# Altium schematic sheet Control-Sheet.SchDoc (part 2 of 3)
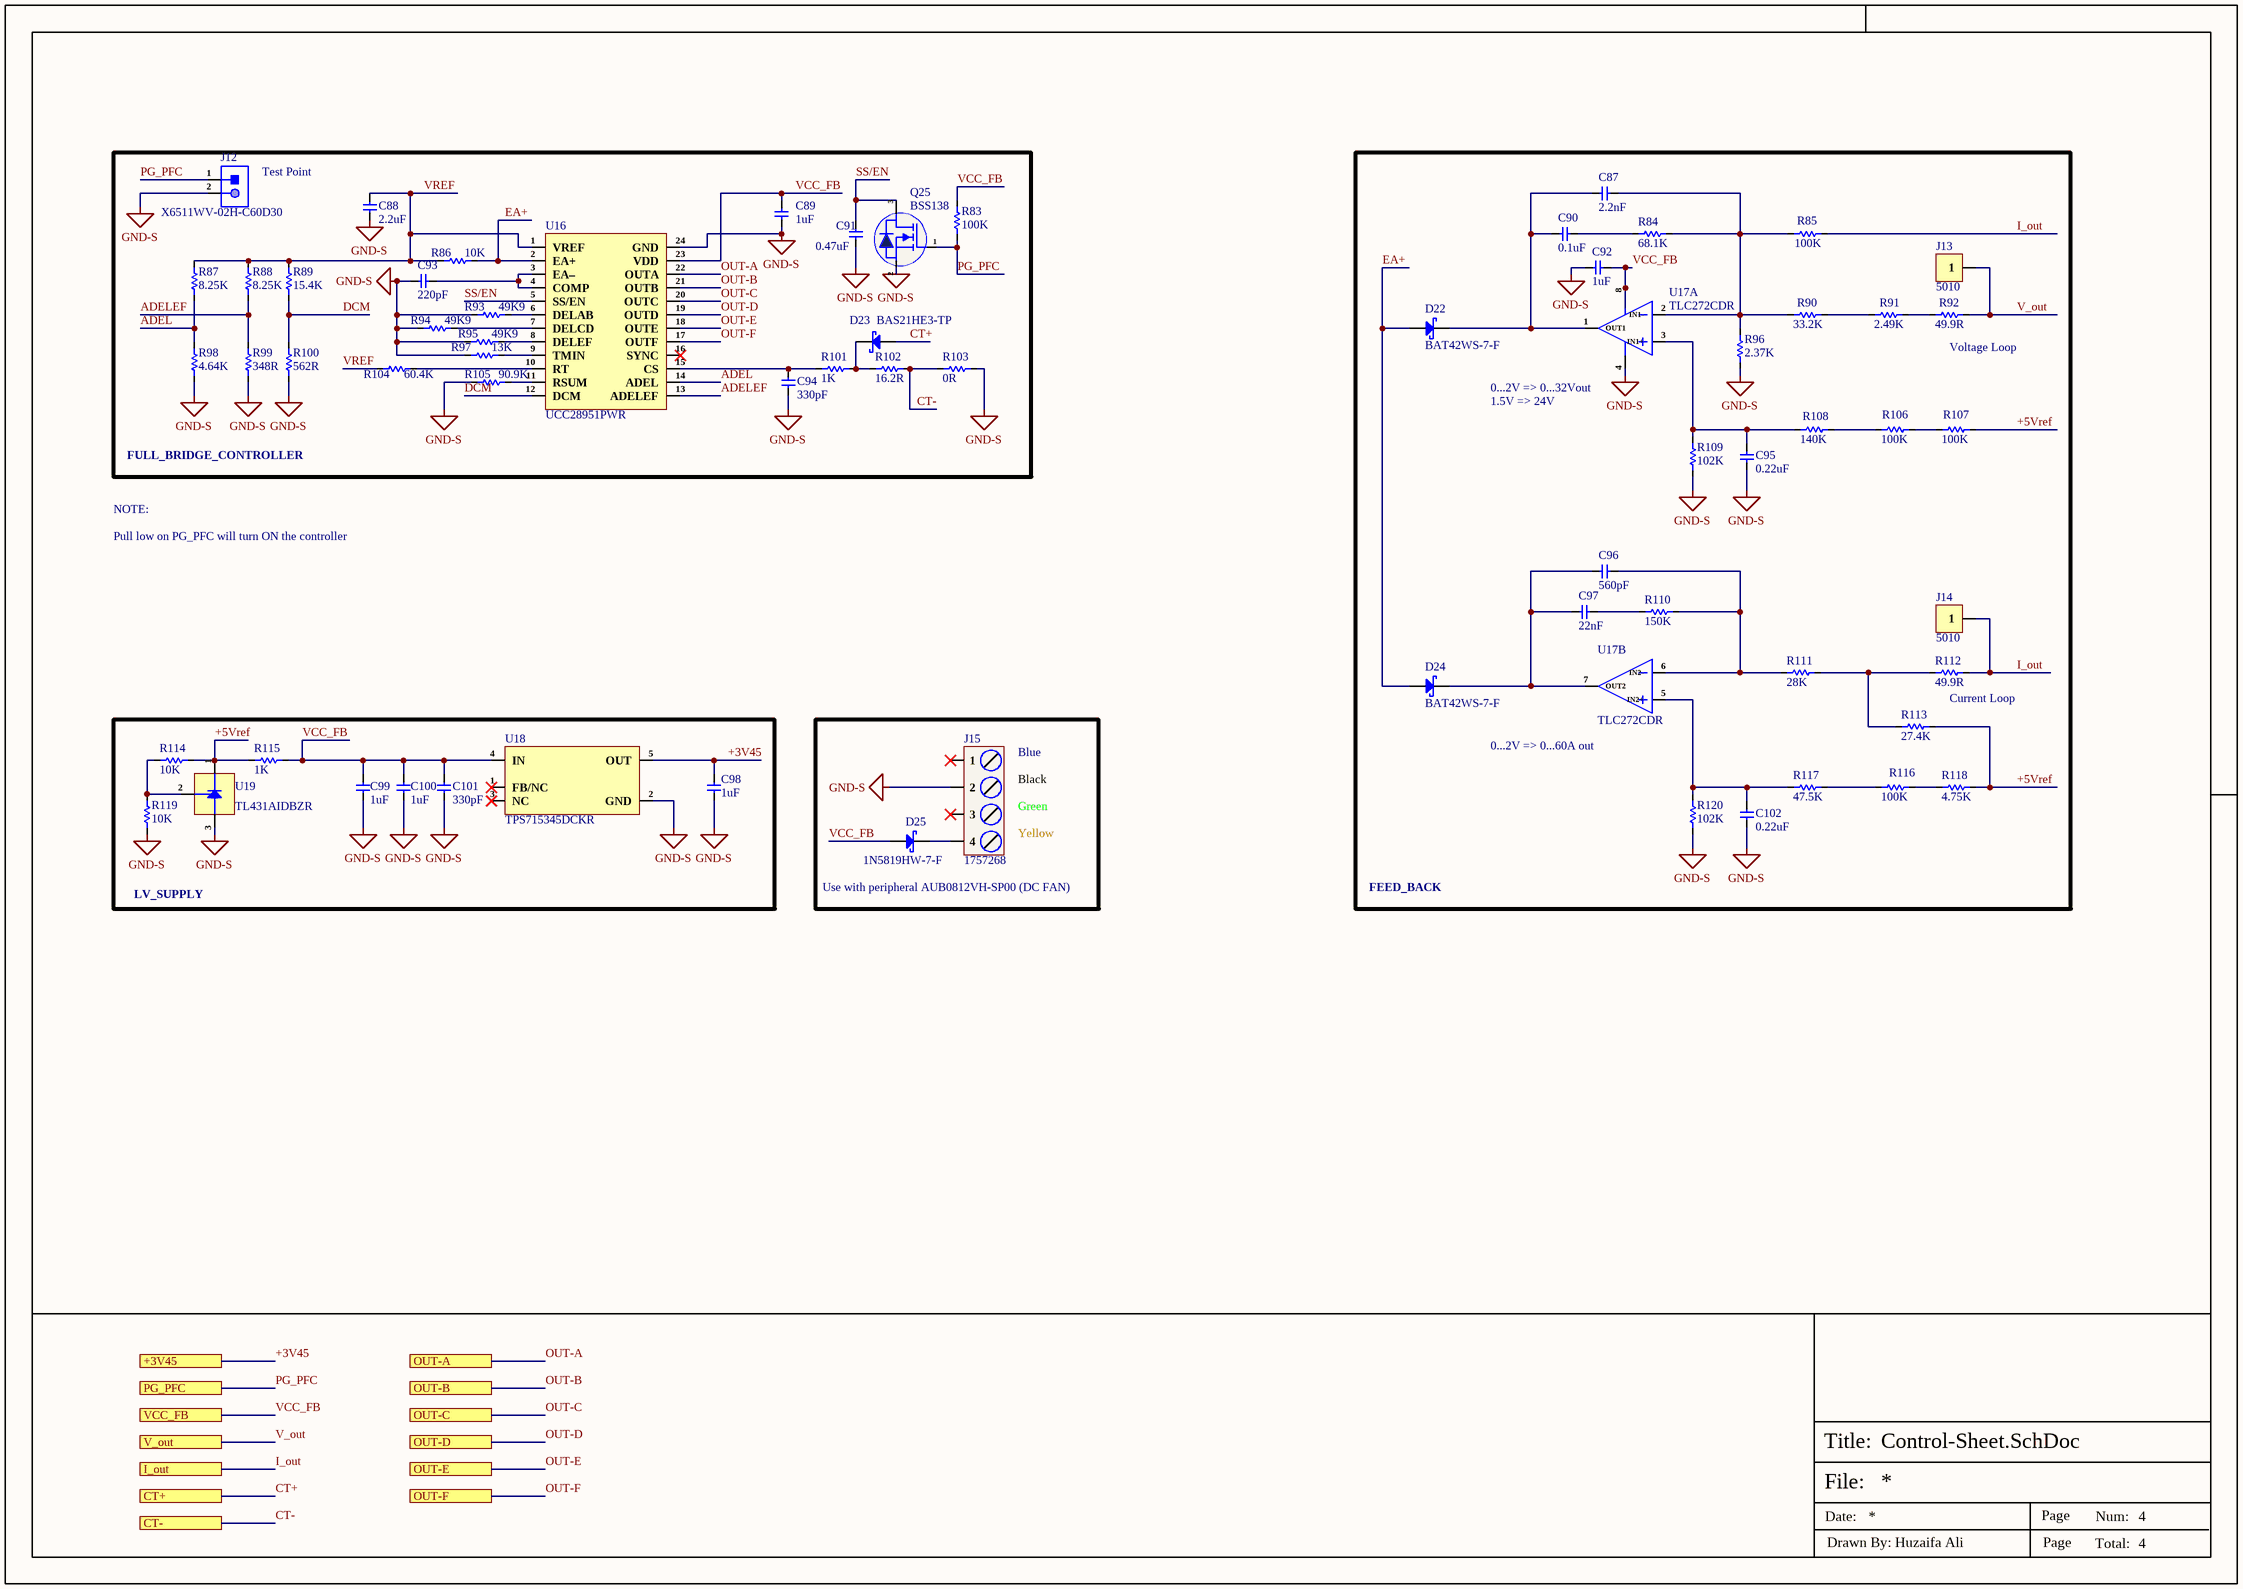
[diagram p1: Control-Sheet.SchDoc]
## Library data of the parts
C87 = C1608C0G1H222JT000N: CAP CER 2200PF 50V C0G 0603; Manufacturer: TDK Corporation; Manufacturer Part Number: C1608C0G1H222J080AA; Item Type: Capacitor; Package: 0603; LCSC Part Number: C76601; ComponentLink1Description: LCSC; ComponentLink1URL: https://www.lcsc.com/product-detail/Multilayer-Ceramic-Capacitors-MLCC-SMD-SMT_TDK-C1608C0G1H222JT000N_C76601.html
C88 = EMK212B7225KGHT: CAP CER 2.2UF 16V X7R 0805; Manufacturer: Taiyo Yuden; Item Type: Capacitors; Material: 4241ConductorMaterial; Supplier: Digikey; LCSC Part Number: C385899; Manufacturer Part Number: EMK212B7225KGHT; RoHS: Yes; Stock: 8236; Pricing: 1=0.24, 10=0.137, 50=0.097, 100=0.0847, 500=0.06374, 1000=0.05721 (USD); Lead Free: 5697LeadFree; Halogen Free: 5694HalogenFree; ComponentLink1URL: http://www.mouser.com/ds/2/396/mlcc11_hq_e-541564.pdf?src-supplier=Mouser; ComponentLink1Description: http://www.mouser.com/ds/2/396/mlcc11_hq_e-541564.pdf?src-supplier=Mouser; ComponentLink2URL: https://datasheet.octopart.com/EMK212B7225KGHT-Taiyo-Yuden-datasheet-152732874.pdf?src-supplier=Newark; ComponentLink2Description: https://datasheet.octopart.com/EMK212B7225KGHT-Taiyo-Yuden-datasheet-152732874.pdf?src-supplier=Newark; ComponentLink3URL: https://datasheet.octopart.com/EMK212B7225KGHT-Taiyo-Yuden-datasheet-97186030.pdf?src-supplier=Future+Electronics; ComponentLink3Description: https://datasheet.octopart.com/EMK212B7225KGHT-Taiyo-Yuden-datasheet-97186030.pdf?src-supplier=Future+Electronics; ComponentLink4URL: https://ds.yuden.co.jp/TYCOMPAS/ut/detail?pn=EMK212B7225KGHT  &amp;u=M&src-supplier=Digikey; ComponentLink4Description: https://ds.yuden.co.jp/TYCOMPAS/ut/detail?pn=EMK212B7225KGHT  &amp;u=M&src-supplier=Digikey; ComponentLink5URL: http://www.yuden.co.jp/productdata/catalog/en/mlcc01_hq_e.pdf?src-supplier=Digikey; ComponentLink5Description: http://www.yuden.co.jp/productdata/catalog/en/mlcc01_hq_e.pdf?src-supplier=Digikey; ComponentLink6URL: http://www.yuden.co.jp/ut/product/category/capacitor/putpdf/EMK212B7225KGHT.pdf?src-supplier=Avnet; ComponentLink6Description: http://www.yuden.co.jp/ut/product/category/capacitor/putpdf/EMK212B7225KGHT.pdf?src-supplier=Avnet; ComponentLink7URL: https://datasheet.octopart.com/EMK212B7225KGHT-Taiyo-Yuden-datasheet-154808297.pdf?src-supplier=Master+Electronics; ComponentLink7Description: https://datasheet.octopart.com/EMK212B7225KGHT-Taiyo-Yuden-datasheet-154808297.pdf?src-supplier=Master+Electronics
C89 C92 C98-C100 = C1608X7R1E105K080AB: CAP CER 1UF 25V X7R 0603; Manufacturer: TDK; Item Type: Capacitors; Material: 4241ConductorMaterial; Tolerance: 10%; Supplier: Digikey; Manufacturer Part Number: C1608X7R1E105K080AB; RoHS: Yes; Stock: 239206; Pricing: 1=0.18, 10=0.103, 50=0.0722, 100=0.0627, 500=0.04664, 1000=0.04163 (USD); Mounting Technology: Surface Mount; Case/Package: 0603; Case Code (Metric): 1608; Case Code (Imperial): 0603; Dielectric Material: 4241ConductorMaterial; Min Operating Temperature: -55°C; Max Operating Temperature: 125°C; Value: 1uF; Package Quantity: 1; Voltage Rating: 25V; Packaging: Tape and Reel; Dielectric: X7R; Voltage: 25V; Series: C; Construction: Flat; Length: 1.6mm; Width: 0.031inch; Height: 0.8mm; Thickness: 0.037inch; Depth: 0.8mm; Radiation Hardening: No; Reach SVHC Compliant: No; Lead Free: Lead Free; RoHS Compliant: Yes; ComponentLink1URL: https://datasheet.ciiva.com/23802/1796654-23802776.pdf?src-supplier=Newark; ComponentLink1Description: https://datasheet.ciiva.com/23802/1796654-23802776.pdf?src-supplier=Newark; ComponentLink2URL: https://datasheet.ciiva.com/22725/1913358-22725530.pdf?src-supplier=Element14; ComponentLink2Description: https://datasheet.ciiva.com/22725/1913358-22725530.pdf?src-supplier=Element14; ComponentLink3URL: https://datasheet.ciiva.com/28693/mlcc-commercial-general-en-28693447.pdf?src-supplier=Element14; ComponentLink3Description: https://datasheet.ciiva.com/28693/mlcc-commercial-general-en-28693447.pdf?src-supplier=Element14; ComponentLink4URL: https://datasheet.ciiva.com/6290/tdkmlcccaprange-6290854.pdf?src-supplier=Digikey; ComponentLink4Description: https://datasheet.ciiva.com/6290/tdkmlcccaprange-6290854.pdf?src-supplier=Digikey; ComponentLink5URL: https://datasheet.ciiva.com/26834/getdatasheetpartid-727834-26834380.pdf?src-supplier=Verical; ComponentLink5Description: https://datasheet.ciiva.com/26834/getdatasheetpartid-727834-26834380.pdf?src-supplier=Verical
C90 = CL10B104KB8WPNC: CAP CER 0.1UF 50V X7R 0603; Item Type: Capacitor; Material: 4241ConductorMaterial; Value: 100nF; Tolerance: 10%; LCSC Part Number: C307348; ComponentLink1Description: LCSC; Supplier: Rs; Supplier Part Number: 2575919; RoHS: Yes; Category: Ceramic Capacitors; Stock: 400; Pricing: 100=0.021, 500=0.019, 1000=0.015, 2000=0.01 (GBP); Mounting Technology: Surface Mount; Case/Package: 0603; Case Code (Metric): 1608; Case Code (Imperial): 0603; Min Operating Temperature: -55°C; Max Operating Temperature: 125°C; Packaging: Cut Tape; Voltage Rating: 50V; Series: CL; Voltage Rating (DC): 50V; Height: 900um; Ratings: AEC-Q200; RoHS Compliant: Yes; Lead Free: 5697LeadFree; ComponentLink2URL: http://www.farnell.com/datasheets/2710560.pdf?src-supplier=Farnell; ComponentLink2Description: http://www.farnell.com/datasheets/2710560.pdf?src-supplier=Farnell; ComponentLink3URL: http://www.samsungsem.com/kr/support/product-search/mlcc/CL10B104KB8WPNC.jsp?src-supplier=Digi-Key; ComponentLink3Description: http://www.samsungsem.com/kr/support/product-search/mlcc/CL10B104KB8WPNC.jsp?src-supplier=Digi-Key; ComponentLink4URL: http://www.farnell.com/datasheets/2710560.pdf?src-supplier=Element14; ComponentLink4Description: http://www.farnell.com/datasheets/2710560.pdf?src-supplier=Element14; ComponentLink5URL: https://datasheet.octopart.com/CL10B104KB8WPNC-Samsung-Electro-Mechanics-datasheet-120093645.pdf?src-supplier=Future+Electronics; ComponentLink5Description: https://datasheet.octopart.com/CL10B104KB8WPNC-Samsung-Electro-Mechanics-datasheet-120093645.pdf?src-supplier=Future+Electronics; ComponentLink6URL: http://www.farnell.com/datasheets/2710560.pdf?src-supplier=Newark; ComponentLink6Description: http://www.farnell.com/datasheets/2710560.pdf?src-supplier=Newark; ComponentLink7URL: http://www.samsungsem.com/servlet/FileDownload?type=spec&file=CL10B104KB8WPNC.pdf&src-supplier=Avnet; ComponentLink7Description: http://www.samsungsem.com/servlet/FileDownload?type=spec&file=CL10B104KB8WPNC.pdf&src-supplier=Avnet; ComponentLink8URL: https://datasheet.octopart.com/CL10B104KB8WPNC-Samsung-datasheet-8326407.pdf?src-supplier=TME; ComponentLink8Description: https://datasheet.octopart.com/CL10B104KB8WPNC-Samsung-datasheet-8326407.pdf?src-supplier=TME
C91 = VJ0805Y474KXJTW1BC: CAP CER 0.47UF 16V X7R 0805; Manufacturer: Vishay Vitramon; Item Type: Capacitors; Supplier: Mouser; LCSC Part Number: C2174635; Manufacturer Part Number: VJ0805Y474KXJTW1BC; RoHS: Yes; Stock: 5925; Pricing: 1=0.2, 10=0.092, 50=0.092, 100=0.053, 1000=0.048, 10000=0.037 (USD); ComponentLink1URL: https://datasheet.ciiva.com/5416/vjw1bcbascomseries-223529-5416469.pdf?src-supplier=Mouser; ComponentLink1Description: https://datasheet.ciiva.com/5416/vjw1bcbascomseries-223529-5416469.pdf?src-supplier=Mouser
C93 = C1608C0G1H221JT000N: CAP CER 220PF 50V C0G 0603; Manufacturer: TDK Corporation; Manufacturer Part Number: C1608C0G1H221J080AA; Item Type: Capacitors; Package: 0603; LCSC Part Number: C695131; ComponentLink1Description: LCSC; ComponentLink1URL: https://www.lcsc.com/product-detail/Multilayer-Ceramic-Capacitors-MLCC-SMD-SMT_TDK-C1608C0G1H221JT000N_C695131.html
C94 C101 = CC0603JRNPO9BN331: CAP CER 330PF 50V C0G/NPO 0603; Manufacturer: Yageo; Dielectric Material: Ceramic; Multilayer: Yes; Tolerance  (fill in as +-): 5%; Temperature Characteristics Code: C0G; Item Type: Capacitor; Supplier 1: Future Electronics; Manufacturer Part Number: CC0603JRNPO9BN331; RoHS: Yes; Category: Ceramic Capacitors; Stock 1: 40000; Pricing 1: 4000=0.00990, 16000=0.00940, 20000=0.00980, 40000=0.00910, 80000=0.00930, 100000=0.00880, 160000=0.00830, 200000=0.00900, 500000=0.00850 (USD); Mounting Technology: Surface Mount; Pins: 2; Package Shape: Rectangular; Case/Package: 0603; Terminal Finish: Nickel; Min Operating Temperature: -55°C; Max Operating Temperature: 125°C; JESD-609 Code: e3; Value: 330pF; Capacitor Type: Ceramic; Package Style: SMTMeter; Packaging: Tape and Reel; Tolerance (fill in as +-): 5%; Rated DC Voltage (URdc): 50V; Termination: Wraparound; Length: 1.6mm; Width: 0.8mm; Height: 0.8mm; Reach SVHC Compliant: Yes; RoHS Compliant: Yes; ComponentLink1URL: https://datasheet.ciiva.com:443/pdfs/VipMasterIC/IC/YAGO/YAGO-S-A0009251638/YAGO-S-A0009251638-1.pdf?src-supplier=IHS+Markit; ComponentLink1Description: https://datasheet.ciiva.com:443/pdfs/VipMasterIC/IC/YAGO/YAGO-S-A0009251638/YAGO-S-A0009251638-1.pdf?src-supplier=IHS+Markit; ComponentLink2URL: https://datasheet.ciiva.com/28450/1443161-28450501.pdf?src-supplier=Element14; ComponentLink2Description: https://datasheet.ciiva.com/28450/1443161-28450501.pdf?src-supplier=Element14; ComponentLink3URL: https://datasheet.ciiva.com/144/mlccorderingcode-144957.pdf?src-supplier=Digi-Key; ComponentLink3Description: https://datasheet.ciiva.com/144/mlccorderingcode-144957.pdf?src-supplier=Digi-Key; ComponentLink4URL: https://datasheet.ciiva.com/144/mlccorderingcode-144956.pdf?src-supplier=Digi-Key; ComponentLink4Description: https://datasheet.ciiva.com/144/mlccorderingcode-144956.pdf?src-supplier=Digi-Key; ComponentLink5URL: https://datasheet.ciiva.com/144/mlccorderingcode-144958.pdf?src-supplier=Digi-Key; ComponentLink5Description: https://datasheet.ciiva.com/144/mlccorderingcode-144958.pdf?src-supplier=Digi-Key; ComponentLink6URL: https://datasheet.ciiva.com/8033/1443161-8033739.pdf?src-supplier=Element14; ComponentLink6Description: https://datasheet.ciiva.com/8033/1443161-8033739.pdf?src-supplier=Element14; ComponentLink7URL: https://datasheet.ciiva.com/8033/1443161-8033737.pdf?src-supplier=Element14; ComponentLink7Description: https://datasheet.ciiva.com/8033/1443161-8033737.pdf?src-supplier=Element14; ComponentLink8URL: https://datasheet.ciiva.com/13389/upy-gp-np0-16v-to-50v-8-13389983.pdf?src-supplier=Mouser; ComponentLink8Description: https://datasheet.ciiva.com/13389/upy-gp-np0-16v-to-50v-8-13389983.pdf?src-supplier=Mouser; ComponentLink9URL: https://datasheet.ciiva.com/11587/upy-gp-np0-16v-to-50v-8-11587326.pdf?src-supplier=Avnet; ComponentLink9Description: https://datasheet.ciiva.com/11587/upy-gp-np0-16v-to-50v-8-11587326.pdf?src-supplier=Avnet; ComponentLink10URL: https://datasheet.ciiva.com/26829/getdatasheetpartid-403533-26829382.pdf?src-supplier=Verical; ComponentLink10Description: https://datasheet.ciiva.com/26829/getdatasheetpartid-403533-26829382.pdf?src-supplier=Verical; Supplier Part Number 1: 8843708; LCSC Part Number: C62784
C95 C102 = CC0603KRX7R7BB224: CAP CER 0.22UF 16V X7R 0603; Manufacturer: Yageo; Item Type: Capacitor; Material: 4241ConductorMaterial; Supplier: Digikey; Supplier Part Number: 311-1426-1-ND; Manufacturer Part Number: CC0603KRX7R7BB224; RoHS: Yes; Stock: 45192; Pricing: 1=0.1, 10=0.058, 50=0.0334, 100=0.0258, 500=0.01944, 1000=0.01528 (USD); Voltage Rating (DC): 16V; Lead Free: 5697LeadFree; Halogen Free: 5694HalogenFree; ComponentLink1URL: https://datasheet.ciiva.com/11788/0900766b80d84f1d-11788400.pdf?src-supplier=Rs; ComponentLink1Description: https://datasheet.ciiva.com/11788/0900766b80d84f1d-11788400.pdf?src-supplier=Rs; ComponentLink2URL: https://datasheet.ciiva.com/176/mlccorderingcode-176606.pdf?src-supplier=Digikey; ComponentLink2Description: https://datasheet.ciiva.com/176/mlccorderingcode-176606.pdf?src-supplier=Digikey; ComponentLink3URL: https://datasheet.ciiva.com/176/mlccorderingcode-176607.pdf?src-supplier=Digikey; ComponentLink3Description: https://datasheet.ciiva.com/176/mlccorderingcode-176607.pdf?src-supplier=Digikey; ComponentLink4URL: https://datasheet.ciiva.com/176/mlccorderingcode-176608.pdf?src-supplier=Digikey; ComponentLink4Description: https://datasheet.ciiva.com/176/mlccorderingcode-176608.pdf?src-supplier=Digikey
C96 = 06035A561JAT2A: CAP CER 560PF 50V C0G/NP0 0603; Manufacturer: Kyocera AVX; Item Type: Capacitor; Supplier: Future Electronics; LCSC Part Number: C597173; Manufacturer Part Number: 06035A561JAT2A; RoHS: Yes; Stock: 180000; Pricing: 4000=0.0172, 16000=0.0165, 40000=0.0091, 60000=0.0158, 100000=0.0088, 120000=0.0155, 160000=0.0083, 300000=0.0148 (USD); ComponentLink1URL: https://datasheet.ciiva.com/27051/1032160-27051276.pdf?src-supplier=Jameco; ComponentLink1Description: https://datasheet.ciiva.com/27051/1032160-27051276.pdf?src-supplier=Jameco; ComponentLink2URL: https://datasheet.ciiva.com/16286/ccog-16286446.pdf?src-supplier=Future+Electronics; ComponentLink2Description: https://datasheet.ciiva.com/16286/ccog-16286446.pdf?src-supplier=Future+Electronics; ComponentLink3URL: https://datasheet.ciiva.com/150/ccog-150647.pdf?src-supplier=Digikey; ComponentLink3Description: https://datasheet.ciiva.com/150/ccog-150647.pdf?src-supplier=Digikey; ComponentLink4URL: https://datasheet.ciiva.com/150/ccog-150648.pdf?src-supplier=Digikey; ComponentLink4Description: https://datasheet.ciiva.com/150/ccog-150648.pdf?src-supplier=Digikey; ComponentLink5URL: https://datasheet.ciiva.com/150/ccog-150649.pdf?src-supplier=Digikey; ComponentLink5Description: https://datasheet.ciiva.com/150/ccog-150649.pdf?src-supplier=Digikey; ComponentLink6URL: https://datasheet.ciiva.com/2987/ccog-2987809.pdf?src-supplier=Avnet; ComponentLink6Description: https://datasheet.ciiva.com/2987/ccog-2987809.pdf?src-supplier=Avnet; ComponentLink7URL: https://datasheet.ciiva.com/2987/ccog-2987810.pdf?src-supplier=Avnet; ComponentLink7Description: https://datasheet.ciiva.com/2987/ccog-2987810.pdf?src-supplier=Avnet; ComponentLink8URL: https://datasheet.ciiva.com/5423/ccog-5423589.pdf?src-supplier=Mouser; ComponentLink8Description: https://datasheet.ciiva.com/5423/ccog-5423589.pdf?src-supplier=Mouser; ComponentLink9URL: https://datasheet.ciiva.com/14598/70001039-14598549.pdf?src-supplier=Allied+Electronics; ComponentLink9Description: https://datasheet.ciiva.com/14598/70001039-14598549.pdf?src-supplier=Allied+Electronics; ComponentLink10URL: https://datasheet.ciiva.com/1124/425357-1124836.pdf?src-supplier=Element14; ComponentLink10Description: https://datasheet.ciiva.com/1124/425357-1124836.pdf?src-supplier=Element14; ComponentLink11URL: https://datasheet.ciiva.com/1124/425357-1124837.pdf?src-supplier=Element14; ComponentLink11Description: https://datasheet.ciiva.com/1124/425357-1124837.pdf?src-supplier=Element14
C97 = CGA3E2X7R2A223K080AA: CAP CER 0.022UF 100V X7R 0603; Manufacturer: TDK; Tolerance: 10%; Item Type: Capacitor; Supplier 1: Digi-Key; Manufacturer Part Number: CGA3E2X7R2A223K080AA; RoHS: Yes; Category: Ceramic Capacitors; Stock 1: 56079; Pricing 1: 1=0.11000, 10=0.07600, 50=0.04340, 100=0.03590, 500=0.02516, 1000=0.02083 (USD); Mount: Surface Mount; Case/Package: 0603; Case Code (Metric): 1608; Case Code (Imperial): 0603; Weight: 7.1E-05oz; Min Operating Temperature: -55°C; Max Operating Temperature: 125°C; Capacitance: 22nF; Voltage Rating: 100V; Packaging: Tape and Reel; Voltage Rating (DC): 100V; Dielectric: X7R; Termination: SMD/SMT; Series: CGA; Package Quantity: 1; Resistor Type: Ceramic; Length: 1.6mm; Width: 0.031inch; Height: 0.8mm; Thickness: 0.035inch; Depth: 0.8mm; Ratings: AEC-Q200; RoHS Compliant: Yes; REACH SVHC: No SVHC; ComponentLink1URL: https://datasheet.ciiva.com/22725/1735406-22725648.pdf?src-supplier=Element14; ComponentLink1Description: https://datasheet.ciiva.com/22725/1735406-22725648.pdf?src-supplier=Element14; ComponentLink2URL: https://datasheet.ciiva.com/24218/cga3e2x7r2a223k080aa-266292-24218959.pdf?src-supplier=Mouser; ComponentLink2Description: https://datasheet.ciiva.com/24218/cga3e2x7r2a223k080aa-266292-24218959.pdf?src-supplier=Mouser; ComponentLink3URL: https://datasheet.ciiva.com/7975/1807242-7975349.pdf?src-supplier=Element14; ComponentLink3Description: https://datasheet.ciiva.com/7975/1807242-7975349.pdf?src-supplier=Element14; Supplier Part Number 1: 445-5814-1-ND; LCSC Part Number: C2167165
D22 D24 = BAT42WS-7-F: DIODE SCHOTTKY 30V 200MA SOD323; Manufacturer: Diodes; Supplier: Future Electronics; LCSC Part Number: C134397; Manufacturer Part Number: BAT42WS-7-F; RoHS: Yes; Item Type: Diode; Stock: 6000; Pricing: 3000=0.0556, 9000=0.0535, 15000=0.0526, 30000=0.0499, 45000=0.0506, 60000=0.048, 75000=0.0489 (USD); ComponentLink1URL: https://datasheet.ciiva.com/4715/ds30100-83070-4715539.pdf?src-supplier=Mouser; ComponentLink1Description: https://datasheet.ciiva.com/4715/ds30100-83070-4715539.pdf?src-supplier=Mouser; ComponentLink2URL: https://datasheet.ciiva.com/8301/ds30100-8301357.pdf?src-supplier=Avnet; ComponentLink2Description: https://datasheet.ciiva.com/8301/ds30100-8301357.pdf?src-supplier=Avnet; ComponentLink3URL: https://datasheet.ciiva.com/1180/ds30100-1180188.pdf?src-supplier=Element14; ComponentLink3Description: https://datasheet.ciiva.com/1180/ds30100-1180188.pdf?src-supplier=Element14; ComponentLink4URL: https://datasheet.ciiva.com/912/ds30100-912909.pdf?src-supplier=Digikey; ComponentLink4Description: https://datasheet.ciiva.com/912/ds30100-912909.pdf?src-supplier=Digikey; ComponentLink5URL: https://datasheet.ciiva.com/912/ds30100-912910.pdf?src-supplier=Digikey; ComponentLink5Description: https://datasheet.ciiva.com/912/ds30100-912910.pdf?src-supplier=Digikey; ComponentLink6URL: https://datasheet.ciiva.com/912/ds30100-912911.pdf?src-supplier=Digikey; ComponentLink6Description: https://datasheet.ciiva.com/912/ds30100-912911.pdf?src-supplier=Digikey
D23 = BAS21HE3-TP: 200V Independent Type 1.25V@200mA 50ns 200mA SOT-23 Switching Diodes ROHS; Manufacturer: MCC; Item Type: Diode; Manufacturer Part Number: BAS21HE3-TP; Package: SOT-23; LCSC Part Number: C3313195; ComponentLink1Description: LCSC; ComponentLink1URL: https://www.lcsc.com/product-detail/Switching-Diodes_MCC-Micro-Commercial-Components-BAS21HE3-TP_C3313195.html
D25 = 1N5819HW-7-F: DIODE SCHOTTKY 40V 1A SOD123; Manufacturer: Diodes; Forward Voltage: 450mV; Max Reverse Current: 50uA; Element Configuration: Single; Max Forward Surge Current (Ifsm): 25A; Max Power Dissipation: 450mW; Polarity: Standard; Capacitance: 110pF; Supplier 1: Digi-Key; Manufacturer Part Number: 1N5819HW-7-F; RoHS: Yes; Category: Schottky Diodes; Pricing 1: 1=0.46000, 10=0.34500, 100=0.19530, 500=0.12936, 1000=0.09918 (USD); Case/Package: SOD-123-2; Number of Pins: 2; Weight: 0.000353oz; Contact Plating: Tin,Matte; Min Operating Temperature: -65°C; Max Operating Temperature: 125°C; Forward Current: 1A; Max Repetitive Reverse Voltage (Vrrm): 40V; Packaging: Tape and Reel; Peak Non-Repetitive Surge Current: 25A; Package Quantity: 3000; Average Rectified Current: 1A; Termination: SMD/SMT; Voltage Rating (DC): 40V; Current Rating: 1A; Output Current: 1A; Max Reverse Voltage (DC): 40V; Series: -; Length: 2.85mm; Width: 1.7mm; Height: 1.25mm; Radiation Hardening: No; RoHS Compliant: Yes; REACH SVHC: No SVHC; Lead Free: Lead Free; ComponentLink1URL: https://datasheet.ciiva.com/16303/ds30217-16303296.pdf?src-supplier=Future+Electronics; ComponentLink1Description: https://datasheet.ciiva.com/16303/ds30217-16303296.pdf?src-supplier=Future+Electronics; ComponentLink2URL: https://datasheet.ciiva.com/27092/1538419-27092484.pdf?src-supplier=Jameco; ComponentLink2Description: https://datasheet.ciiva.com/27092/1538419-27092484.pdf?src-supplier=Jameco; ComponentLink3URL: https://datasheet.ciiva.com/912/ds30217-912801.pdf?src-supplier=Digi-Key; ComponentLink3Description: https://datasheet.ciiva.com/912/ds30217-912801.pdf?src-supplier=Digi-Key; ComponentLink4URL: https://datasheet.ciiva.com/1177/ds30217-1177089.pdf?src-supplier=Element14; ComponentLink4Description: https://datasheet.ciiva.com/1177/ds30217-1177089.pdf?src-supplier=Element14; ComponentLink5URL: https://datasheet.ciiva.com/912/ds30217-912802.pdf?src-supplier=Digi-Key; ComponentLink5Description: https://datasheet.ciiva.com/912/ds30217-912802.pdf?src-supplier=Digi-Key; ComponentLink6URL: https://datasheet.ciiva.com/912/ds30217-912803.pdf?src-supplier=Digi-Key; ComponentLink6Description: https://datasheet.ciiva.com/912/ds30217-912803.pdf?src-supplier=Digi-Key; ComponentLink7URL: https://datasheet.ciiva.com/8303/ds30217-8303132.pdf?src-supplier=Avnet; ComponentLink7Description: https://datasheet.ciiva.com/8303/ds30217-8303132.pdf?src-supplier=Avnet; ComponentLink8URL: https://datasheet.ciiva.com/25919/ds30217-25919644.pdf?src-supplier=Avnet+Europe; ComponentLink8Description: https://datasheet.ciiva.com/25919/ds30217-25919644.pdf?src-supplier=Avnet+Europe; Supplier Part Number 1: 1N5819HW-FDICT-ND; LCSC Part Number: C82544; Item Type: Diode
J12 = X6511WV-02H-C60D30: Gold 250V 3A Straight Square Pins 2.5mm 2P 260℃ 6mm -40℃~+105℃ 3mm 2.54mm Plugin Black Brass 1x2P Plugin,P=2.54mm Pin Headers ROHS; Manufacturer: XKB; Item Type: Male Header; Manufacturer Part Number: X6511WV-02H-C60D30; Package: Plugin,P=2.54mm; LCSC Part Number: C706874; ComponentLink1Description: LCSC; ComponentLink1URL: https://www.lcsc.com/product-detail/Pin-Headers_XKB-Connectivity-X6511WV-02H-C60D30_C706874.html
J13 J14 = 5010: PC TEST POINT MULTIPURPOSE RED; Manufacturer: Keystone Electronics; Item Type: Connectors; Supplier: Digikey; LCSC Part Number: C2906765; Manufacturer Part Number: 5010; RoHS: Yes; Stock: 128327; Pricing: 1=0.38, 25=0.308, 100=0.3015, 250=0.28304, 500=0.2523, 1000=0.17746, 2500=0.16225, 5000=0.15211 (USD); ComponentLink1URL: https://datasheet.ciiva.com/11744/0900766b8009b7c7-11744920.pdf?src-supplier=Rs; ComponentLink1Description: https://datasheet.ciiva.com/11744/0900766b8009b7c7-11744920.pdf?src-supplier=Rs; ComponentLink2URL: https://datasheet.ciiva.com/16506/m60-2p60-16506972.pdf?src-supplier=Future+Electronics; ComponentLink2Description: https://datasheet.ciiva.com/16506/m60-2p60-16506972.pdf?src-supplier=Future+Electronics; ComponentLink3URL: https://datasheet.ciiva.com/22631/1703983-22631113.pdf?src-supplier=Element14; ComponentLink3Description: https://datasheet.ciiva.com/22631/1703983-22631113.pdf?src-supplier=Element14; ComponentLink4URL: https://datasheet.ciiva.com/16883/70182825-16883886.pdf?src-supplier=Allied+Electronics; ComponentLink4Description: https://datasheet.ciiva.com/16883/70182825-16883886.pdf?src-supplier=Allied+Electronics; ComponentLink5URL: https://datasheet.ciiva.com/2917/5010-2917626.pdf?src-supplier=Digikey; ComponentLink5Description: https://datasheet.ciiva.com/2917/5010-2917626.pdf?src-supplier=Digikey; ComponentLink6URL: https://datasheet.ciiva.com/1454/1703983-1454833.pdf?src-supplier=Element14; ComponentLink6Description: https://datasheet.ciiva.com/1454/1703983-1454833.pdf?src-supplier=Element14
J15 = 1757268: TERM BLOCK HDR 4POS 90DEG 5.08MM; Manufacturer: Phoenix Contact; Item Type: Terminal Blocks; Voltage Rating (DC): 250V; Gender: 29Gender; Supplier: Digikey; LCSC Part Number: C90076; Manufacturer Part Number: 1757268; RoHS: Yes; Stock: 18354; Pricing: 1=1.49, 10=1.003, 25=0.9588 (USD); Housing Color: 49Colour; Max Operating Temperature: 70°C; Lead Free: 5697LeadFree; ComponentLink1URL: https://datasheet.ciiva.com/15197/getdatasheetpartid-176352-15197330.pdf?src-supplier=Verical; ComponentLink1Description: https://datasheet.ciiva.com/15197/getdatasheetpartid-176352-15197330.pdf?src-supplier=Verical; ComponentLink2URL: https://datasheet.ciiva.com/795/1757268-795434.pdf?src-supplier=Digikey; ComponentLink2Description: https://datasheet.ciiva.com/795/1757268-795434.pdf?src-supplier=Digikey; ComponentLink3URL: https://datasheet.ciiva.com/7630/1697153-7630841.pdf?src-supplier=Element14; ComponentLink3Description: https://datasheet.ciiva.com/7630/1697153-7630841.pdf?src-supplier=Element14; ComponentLink4URL: https://datasheet.ciiva.com/16096/1757268-16096406.pdf?src-supplier=Onlinecomponents.com; ComponentLink4Description: https://datasheet.ciiva.com/16096/1757268-16096406.pdf?src-supplier=Onlinecomponents.com; ComponentLink5URL: https://datasheet.ciiva.com/29210/569323-da-01-en-grundgehaeuse-1757268-250-st-29210575.pdf?src-supplier=Conrad; ComponentLink5Description: https://datasheet.ciiva.com/29210/569323-da-01-en-grundgehaeuse-1757268-250-st-29210575.pdf?src-supplier=Conrad; ComponentLink6URL: https://datasheet.ciiva.com/16703/70054631-16703596.pdf?src-supplier=Allied+Electronics; ComponentLink6Description: https://datasheet.ciiva.com/16703/70054631-16703596.pdf?src-supplier=Allied+Electronics
Q25 = BSS138: 50V 220mA 3.5Ω@10V,220mA 225mW 1.6V@1mA N Channel SOT-23 MOSFETs ROHS; Manufacturer: Slkor(SLKORMICRO Elec.); Item Type: Mosfet; Manufacturer Part Number: BSS138; Package: SOT-23; LCSC Part Number: C426569; ComponentLink1Description: LCSC; ComponentLink1URL: https://www.lcsc.com/product-detail/MOSFETs_Slkor-SLKORMICRO-Elec-BSS138_C426569.html
R83 R85 R106 R107 R116 = CRCW0603100KFKEA: RES SMD 100K OHM 1% 1/10W 0603; Item Type: Resistor; Value: 100kR; Temperature Coefficient: 100ppm/°C; Voltage Rating: 75V; Power Rating: 100mW; ComponentLink1Description: LCSC; Supplier: Mouser; Supplier Part Number: 71-CRCW0603-100K-E3; RoHS: Yes; Category: Chip SMD Resistors; Stock: 716604; Pricing: 1=0.1, 10=0.019, 50=0.019, 100=0.009, 1000=0.007, 10000=0.004 (USD); Case/Package: 345Case; Pins: 2NUMBER; Case Code (Imperial): 0603; Case Code (Metric): 1608; Min Operating Temperature: -55°C; Max Operating Temperature: 155°C; Tolerance: 1%; Resistor Type: Thick Film; Resistance Tolerance: 1%; Packaging: 13Packaging; Voltage Rating (DC): 75V; Features: 6309FeaturesType; Height: 500um; RoHS Compliant: Yes; Lead Free: 5697LeadFree; ComponentLink2URL: http://www.farnell.com/datasheets/2310790.pdf?src-supplier=Farnell; ComponentLink2Description: http://www.farnell.com/datasheets/2310790.pdf?src-supplier=Farnell; ComponentLink3URL: https://datasheet.octopart.com/CRCW0603100KFKEA-Vishay-datasheet-14722531.pdf?src-supplier=Newark; ComponentLink3Description: https://datasheet.octopart.com/CRCW0603100KFKEA-Vishay-datasheet-14722531.pdf?src-supplier=Newark; ComponentLink4URL: https://www.vishay.com/docs/20035/dcrcwe3.pdf?src-supplier=Digi-Key; ComponentLink4Description: https://www.vishay.com/docs/20035/dcrcwe3.pdf?src-supplier=Digi-Key; ComponentLink5URL: https://datasheet.octopart.com/CRCW0603100KFKEA-Vishay-datasheet-5300368.pdf?src-supplier=Future+Electronics; ComponentLink5Description: https://datasheet.octopart.com/CRCW0603100KFKEA-Vishay-datasheet-5300368.pdf?src-supplier=Future+Electronics; ComponentLink6URL: http://www.farnell.com/datasheets/2310790.pdf?src-supplier=Newark; ComponentLink6Description: http://www.farnell.com/datasheets/2310790.pdf?src-supplier=Newark; ComponentLink7URL: http://www.farnell.com/datasheets/2310790.pdf?src-supplier=Element14; ComponentLink7Description: http://www.farnell.com/datasheets/2310790.pdf?src-supplier=Element14; ComponentLink8URL: https://datasheet.octopart.com/CRCW0603100KFKEA-Vishay-datasheet-83961561.pdf?src-supplier=Element14; ComponentLink8Description: https://datasheet.octopart.com/CRCW0603100KFKEA-Vishay-datasheet-83961561.pdf?src-supplier=Element14; ComponentLink9URL: https://datasheet.octopart.com/CRCW0603100KFKEA-Vishay-datasheet-8363642.pdf?src-supplier=Verical; ComponentLink9Description: https://datasheet.octopart.com/CRCW0603100KFKEA-Vishay-datasheet-8363642.pdf?src-supplier=Verical; ComponentLink10URL: https://datasheet.octopart.com/CRCW0603100KFKEA-Vishay-datasheet-508714.pdf?src-supplier=Farnell; ComponentLink10Description: https://datasheet.octopart.com/CRCW0603100KFKEA-Vishay-datasheet-508714.pdf?src-supplier=Farnell; ComponentLink11URL: https://datasheet.octopart.com/CRCW0603100KFKEA-Vishay-datasheet-17834126.pdf?src-supplier=TME; ComponentLink11Description: https://datasheet.octopart.com/CRCW0603100KFKEA-Vishay-datasheet-17834126.pdf?src-supplier=TME; LCSC Part Number: C844916
R84 = 0603WAF6812T5E: 100mW Thick Film Resistors 75V ±100ppm/℃ ±1% 68.1kΩ 0603 Chip Resistor - Surface Mount ROHS; Manufacturer: Uniroyal; Supplier: LCSC; LCSC Part Number: C25976; Manufacturer Part Number: 0603WAF6812T5E; RoHS: No; Item Type: Resistor
R86 R114 R119 = RK73G1JTTD1002F: RES 10K OHM 1% 1/10W 0603; Item Type: Resistor; Value: 10kR; Power Rating: 100mW; Voltage Rating: 75V; Temperature Coefficient: 50ppm/°C; LCSC Part Number: C362180; ComponentLink1Description: LCSC; Supplier: Digi-Key; Supplier Part Number: 2019-RK73G1JTTD1002FCT-ND; RoHS: Yes; Category: Chip SMD Resistors; Stock: 249394; Pricing: 1=0.22, 10=0.118, 50=0.0812, 100=0.0699, 500=0.0513, 1000=0.04545 (USD); Case/Package: 0603; Case Code (Imperial): 0603; Case Code (Metric): 1608; Min Operating Temperature: -55°C; Max Operating Temperature: 125°C; Tolerance: 1%; Packaging: Tape and Reel; Termination: SMD/SMT; Series: RK73G; Construction: Rectangular; Length: 1.6mm; Depth: 0.8mm; Military Standard: Not; RoHS Compliant: Yes; ComponentLink2URL: http://www.mouser.com/ds/2/219/RK73G-9863.pdf?src-supplier=Mouser; ComponentLink2Description: http://www.mouser.com/ds/2/219/RK73G-9863.pdf?src-supplier=Mouser
R87 R88 = CRCW06038K25FKEA: RES SMD 8.25K OHM 1% 1/10W 0603; Manufacturer: Vishay; Item Type: Resistors; Voltage Rating (DC): 75V; Supplier: Mouser; LCSC Part Number: C843969; Manufacturer Part Number: CRCW06038K25FKEA; RoHS: Yes; Stock: 19942; Pricing: 1=0.1, 10=0.017, 50=0.017, 100=0.01, 1000=0.008, 10000=0.005 (USD); Lead Free: 5697LeadFree; ComponentLink1URL: https://datasheet.ciiva.com/11810/0900766b80d98afc-11810884.pdf?src-supplier=Rs; ComponentLink1Description: https://datasheet.ciiva.com/11810/0900766b80d98afc-11810884.pdf?src-supplier=Rs; ComponentLink2URL: https://datasheet.ciiva.com/5550/dcrcwe3-109170-5550394.pdf?src-supplier=Mouser; ComponentLink2Description: https://datasheet.ciiva.com/5550/dcrcwe3-109170-5550394.pdf?src-supplier=Mouser; ComponentLink3URL: https://datasheet.ciiva.com/16762/70201119-16762982.pdf?src-supplier=Allied+Electronics; ComponentLink3Description: https://datasheet.ciiva.com/16762/70201119-16762982.pdf?src-supplier=Allied+Electronics; ComponentLink4URL: https://datasheet.ciiva.com/22869/70201119-22869848.pdf?src-supplier=Allied+Electronics; ComponentLink4Description: https://datasheet.ciiva.com/22869/70201119-22869848.pdf?src-supplier=Allied+Electronics; ComponentLink5URL: https://datasheet.ciiva.com/7679/1697337-7679147.pdf?src-supplier=Element14; ComponentLink5Description: https://datasheet.ciiva.com/7679/1697337-7679147.pdf?src-supplier=Element14; ComponentLink6URL: https://datasheet.ciiva.com/16427/dcrcwe3-16427340.pdf?src-supplier=Future+Electronics; ComponentLink6Description: https://datasheet.ciiva.com/16427/dcrcwe3-16427340.pdf?src-supplier=Future+Electronics; ComponentLink7URL: https://datasheet.ciiva.com/2494/dcrcwe3-2494900.pdf?src-supplier=Digikey; ComponentLink7Description: https://datasheet.ciiva.com/2494/dcrcwe3-2494900.pdf?src-supplier=Digikey; ComponentLink8URL: https://datasheet.ciiva.com/2494/dcrcwe3-2494901.pdf?src-supplier=Digikey; ComponentLink8Description: https://datasheet.ciiva.com/2494/dcrcwe3-2494901.pdf?src-supplier=Digikey; ComponentLink9URL: https://datasheet.ciiva.com/2494/dcrcwe3-2494902.pdf?src-supplier=Digikey; ComponentLink9Description: https://datasheet.ciiva.com/2494/dcrcwe3-2494902.pdf?src-supplier=Digikey
R89 = RC0603FR-0715K4L: RES 15.4K OHM 1% 1/10W 0603; Manufacturer: Yageo; Item Type: Resistors; Voltage Rating (DC): 50V; Supplier: Future Electronics; LCSC Part Number: C185370; Manufacturer Part Number: RC0603FR-0715K4L; RoHS: Yes; Stock: 230000; Pricing: 5000=0.0022, 50000=0.0021, 150000=0.0021, 375000=0.002, 1000000=0.0019 (USD); Lead Free: 5697LeadFree; RoHS Compliant: 5897YesNo; ComponentLink1URL: https://datasheet.ciiva.com/15159/getdatasheetpartid-28826-15159212.pdf?src-supplier=Verical; ComponentLink1Description: https://datasheet.ciiva.com/15159/getdatasheetpartid-28826-15159212.pdf?src-supplier=Verical; ComponentLink2URL: https://datasheet.ciiva.com/11808/0900766b80f96399-11808544.pdf?src-supplier=Rs; ComponentLink2Description: https://datasheet.ciiva.com/11808/0900766b80f96399-11808544.pdf?src-supplier=Rs; ComponentLink3URL: https://datasheet.ciiva.com/2454/pyu-r-int-thick-7-2454348.pdf?src-supplier=Digikey; ComponentLink3Description: https://datasheet.ciiva.com/2454/pyu-r-int-thick-7-2454348.pdf?src-supplier=Digikey; ComponentLink4URL: https://datasheet.ciiva.com/2454/pyu-r-int-thick-7-2454349.pdf?src-supplier=Digikey; ComponentLink4Description: https://datasheet.ciiva.com/2454/pyu-r-int-thick-7-2454349.pdf?src-supplier=Digikey; ComponentLink5URL: https://datasheet.ciiva.com/2454/pyu-r-int-thick-7-2454350.pdf?src-supplier=Digikey; ComponentLink5Description: https://datasheet.ciiva.com/2454/pyu-r-int-thick-7-2454350.pdf?src-supplier=Digikey
R90 = RC0603FR-0733K2L: RES 33.2K OHM 1% 1/10W 0603; Manufacturer: Yageo; Resistance: 33.2kR; Power Rating: 100mW; Voltage Rating: 50V; Temperature Coefficient: 100ppm/°C; Supplier 1: Digi-Key; Manufacturer Part Number: RC0603FR-0733K2L; RoHS: Yes; Category: Chip SMD Resistors; Stock 1: 1293262; Pricing 1: 1=0.10000, 10=0.02300, 100=0.00930, 1000=0.00417, 2500=0.00362 (USD); Mount: Surface Mount; Case/Package: 0603; Case Code (Imperial): 0603; Case Code (Metric): 1608; Size Code: 0603; Min Operating Temperature: -55°C; Max Operating Temperature: 155°C; Tolerance: 1%; Packaging: Tape and Reel; Termination: SMD/SMT; Resistor Type: Thick Film; Voltage Rating (DC): 50V; Features: Moisture Resistant; Series: RC; Max Power Dissipation: 100mW; Number of Terminations: 2; Construction: Rectangular; Technology: THICK FILM; Length: 1.6mm; Height: 0.45mm; Depth: 0.8mm; Military Standard: Not; Lead Free: Lead Free; RoHS Compliant: Yes; ComponentLink1URL: https://datasheet.ciiva.com/11808/0900766b80f96399-11808316.pdf?src-supplier=RSComponents; ComponentLink1Description: https://datasheet.ciiva.com/11808/0900766b80f96399-11808316.pdf?src-supplier=RSComponents; Supplier Part Number 1: 311-33.2KHRCT-ND; LCSC Part Number: C185338
R91 = RC0603FR-072K49L: RES 2.49K OHM 1% 1/10W 0603; Manufacturer: Yageo; Power Rating: 100mW; Temperature Coefficient: 100ppm/°C; Value: 2.49kR; Voltage Rating: 50V; Item Type: Resistor; Supplier: Future Electronics; Supplier Part Number: 4546610; Manufacturer Part Number: RC0603FR-072K49L; RoHS: Yes; Category: Chip SMD Resistors; Stock: 2930000; Pricing: 5000=0.0013, 50000=0.0013, 150000=0.0012, 375000=0.0012, 1000000=0.0011 (USD); Pins: 2NUMBER; Case Code (Imperial): 0603; Case Code (Metric): 1608; Case/Package: 0603; Min Operating Temperature: -55°C; Max Operating Temperature: 155°C; Tolerance: 1%; Series: RC; Packaging: Tape and Reel; Termination: SMD/SMT; Resistor Type: Thick Film; Features: Moisture Resistant; Max Power Dissipation: 100mW; Number of Terminations: 2; Resistance Tolerance: 1%; Voltage Rating (DC): 50V; Length: 1.6mm; Width: 800um; Height: 450um; RoHS Compliant: Yes; Reach SVHC Compliant: Unknown; Lead Free: 5697LeadFree; ComponentLink1URL: https://datasheet.ciiva.com/46395/443971-46395001.pdf?src-supplier=Element14; ComponentLink1Description: https://datasheet.ciiva.com/46395/443971-46395001.pdf?src-supplier=Element14; LCSC Part Number: C108190
R92 R112 = RC0603FR-0749R9L: RES 49.9 OHM 1% 1/10W 0603; Manufacturer: Yageo; Temperature Coefficient: 100ppm/°C; Voltage Rating (DC): 50V; Power Rating: 100mW; Item Type: Resistor; Supplier 1: Arrow Electronics; Manufacturer Part Number: RC0603FR-0749R9L; RoHS: Yes; Category: Chip SMD Resistors; Stock 1: 2075000; Pricing 1: 5000=0.00280 (USD); Case/Package: 0603; Number of Pins: 2; Case Code (Imperial): 0603; Case Code (Metric): 1608; Size Code: 0603; Min Operating Temperature: -55°C; Max Operating Temperature: 155°C; Tolerance: 1%; Resistance: 49.9R; Resistor Type: Thick Film; Packaging: Tape and Reel; Voltage Rating: 50V; Termination: SMD/SMT; Features: Moisture Resistant; Series: RC; Max Power Dissipation: 100mW; Number of Terminations: 2; Construction: Rectangular; Resistance Tolerance: 1%; Technology: THICK FILM; Length: 1.6mm; Height: 0.45mm; Depth: 0.8mm; Lead Free: Lead Free; REACH SVHC: No SVHC; Military Standard: Not; RoHS Compliant: Yes; ComponentLink1URL: https://datasheet.ciiva.com/11808/0900766b80f96399-11808223.pdf?src-supplier=RSComponents; ComponentLink1Description: https://datasheet.ciiva.com/11808/0900766b80f96399-11808223.pdf?src-supplier=RSComponents; ComponentLink2URL: https://datasheet.ciiva.com/22747/443971-22747527.pdf?src-supplier=Element14; ComponentLink2Description: https://datasheet.ciiva.com/22747/443971-22747527.pdf?src-supplier=Element14; ComponentLink3URL: https://datasheet.ciiva.com/15189/getdatasheetpartid-325421-15189750.pdf?src-supplier=Verical; ComponentLink3Description: https://datasheet.ciiva.com/15189/getdatasheetpartid-325421-15189750.pdf?src-supplier=Verical; Supplier Part Number 1: RC0603FR-0749R9L; LCSC Part Number: C114625
R93-R95 = RC0603FR-0749K9L: RES 49.9K OHM 1% 1/10W 0603; Manufacturer: Yageo; Power Rating: 100mW; Resistance: 49.9kR; Temperature Coefficient: 100ppm/°C; Voltage Rating (DC): 50V; Item Type: Resistor; Supplier 1: Digi-Key; Manufacturer Part Number: RC0603FR-0749K9L; RoHS: Yes; Category: Chip SMD Resistors; Stock 1: 77863; Pricing 1: 1=0.10000, 10=0.02400, 100=0.00970, 1000=0.00436, 2500=0.00378 (USD); Mount: Surface Mount; Case/Package: 0603; Case Code (Metric): 1608; Case Code (Imperial): 0603; Size Code: 0603; Min Operating Temperature: -55°C; Max Operating Temperature: 155°C; Tolerance: 1%; Packaging: Tape and Reel; Package Quantity: 1; Voltage Rating: 50V; Resistor Type: Thick Film; Number of Terminations: 2; Termination: SMD/SMT; Max Power Dissipation: 100mW; Features: Moisture Resistant; Series: RC; Construction: Rectangular; Length: 0.063inch; Width: 0.031inch; Height: 0.022inch; Depth: 0.8mm; Lead Free: Lead Free; Military Standard: Not; RoHS Compliant: Yes; ComponentLink1URL: https://datasheet.ciiva.com/2454/pyu-r-int-thick-7-2454042.pdf?src-supplier=Digi-Key; ComponentLink1Description: https://datasheet.ciiva.com/2454/pyu-r-int-thick-7-2454042.pdf?src-supplier=Digi-Key; ComponentLink2URL: https://datasheet.ciiva.com/2454/pyu-r-int-thick-7-2454043.pdf?src-supplier=Digi-Key; ComponentLink2Description: https://datasheet.ciiva.com/2454/pyu-r-int-thick-7-2454043.pdf?src-supplier=Digi-Key; ComponentLink3URL: https://datasheet.ciiva.com/2454/pyu-r-int-thick-7-2454044.pdf?src-supplier=Digi-Key; ComponentLink3Description: https://datasheet.ciiva.com/2454/pyu-r-int-thick-7-2454044.pdf?src-supplier=Digi-Key; ComponentLink4URL: https://datasheet.ciiva.com/15189/getdatasheetpartid-323805-15189749.pdf?src-supplier=Verical; ComponentLink4Description: https://datasheet.ciiva.com/15189/getdatasheetpartid-323805-15189749.pdf?src-supplier=Verical; Supplier Part Number 1: 311-49.9KHRCT-ND; LCSC Part Number: C114624
R96 = CRCW06032K37FKEA: RES SMD 2.37K OHM 1% 1/10W 0603; Manufacturer: Vishay; Item Type: Resistors; Voltage Rating (DC): 75V; Supplier: Mouser; LCSC Part Number: C2091101; Manufacturer Part Number: CRCW06032K37FKEA; RoHS: Yes; Stock: 34700; Pricing: 1=0.1, 10=0.017, 50=0.017, 100=0.01, 1000=0.008, 10000=0.005 (USD); Lead Free: 5697LeadFree; ComponentLink1URL: https://datasheet.ciiva.com/11812/0900766b80d98afc-11812338.pdf?src-supplier=Rs; ComponentLink1Description: https://datasheet.ciiva.com/11812/0900766b80d98afc-11812338.pdf?src-supplier=Rs; ComponentLink2URL: https://datasheet.ciiva.com/7792/125364-7792183.pdf?src-supplier=Element14; ComponentLink2Description: https://datasheet.ciiva.com/7792/125364-7792183.pdf?src-supplier=Element14; ComponentLink3URL: https://datasheet.ciiva.com/7670/1697337-7670233.pdf?src-supplier=Element14; ComponentLink3Description: https://datasheet.ciiva.com/7670/1697337-7670233.pdf?src-supplier=Element14; ComponentLink4URL: https://datasheet.ciiva.com/7670/1697337-7670234.pdf?src-supplier=Element14; ComponentLink4Description: https://datasheet.ciiva.com/7670/1697337-7670234.pdf?src-supplier=Element14; ComponentLink5URL: https://datasheet.ciiva.com/3257/dcrcwe3-3257383.pdf?src-supplier=Avnet; ComponentLink5Description: https://datasheet.ciiva.com/3257/dcrcwe3-3257383.pdf?src-supplier=Avnet; ComponentLink6URL: https://datasheet.ciiva.com/3257/dcrcwe3-3257384.pdf?src-supplier=Avnet; ComponentLink6Description: https://datasheet.ciiva.com/3257/dcrcwe3-3257384.pdf?src-supplier=Avnet; ComponentLink7URL: https://datasheet.ciiva.com/2466/dcrcwe3-2466221.pdf?src-supplier=Digikey; ComponentLink7Description: https://datasheet.ciiva.com/2466/dcrcwe3-2466221.pdf?src-supplier=Digikey; ComponentLink8URL: https://datasheet.ciiva.com/2466/dcrcwe3-2466222.pdf?src-supplier=Digikey; ComponentLink8Description: https://datasheet.ciiva.com/2466/dcrcwe3-2466222.pdf?src-supplier=Digikey; ComponentLink9URL: https://datasheet.ciiva.com/2466/dcrcwe3-2466223.pdf?src-supplier=Digikey; ComponentLink9Description: https://datasheet.ciiva.com/2466/dcrcwe3-2466223.pdf?src-supplier=Digikey; ComponentLink10URL: https://datasheet.ciiva.com/16761/70201119-16761733.pdf?src-supplier=Allied+Electronics; ComponentLink10Description: https://datasheet.ciiva.com/16761/70201119-16761733.pdf?src-supplier=Allied+Electronics; ComponentLink11URL: https://datasheet.ciiva.com/16215/dcrcwe3-16215145.pdf?src-supplier=Future+Electronics; ComponentLink11Description: https://datasheet.ciiva.com/16215/dcrcwe3-16215145.pdf?src-supplier=Future+Electronics
R97 = RT0603FRE0713KL: RES SMD 13K OHM 1% 1/10W 0603; Manufacturer: Yageo; Item Type: Resistors; Voltage Rating: 75V; Value: 13kR; Power Rating: 100mW; Temperature Coefficient: 50ppm/°C; Voltage Rating (DC): 50V; Supplier: Future Electronics; LCSC Part Number: C863575; Manufacturer Part Number: RT0603FRE0713KL; RoHS: Yes; Stock: 70000; Pricing: 5000=0.0057, 20000=0.0055, 100000=0.0052, 200000=0.0051, 625000=0.0049 (USD); Case/Package: 0603; Case Code (Metric): 1608; Case Code (Imperial): 0603; Contact Plating: Tin,Lead; Min Operating Temperature: -55°C; Max Operating Temperature: 125°C; Tolerance: 1%; Packaging: Tape and Reel; Package Quantity: 5000; Termination: SMD/SMT; Number of Terminations: 2; Max Power Dissipation: 100mW; Series: RT; Length: 0.063inch; Width: 0.031inch; Height: 0.022inch; Lead Free: Lead Free; RoHS Compliant: Yes; ComponentLink1URL: https://datasheet.ciiva.com/2559/pyu-rt-1-to-0-05-rohs-l-5-2559527.pdf?src-supplier=Digikey; ComponentLink1Description: https://datasheet.ciiva.com/2559/pyu-rt-1-to-0-05-rohs-l-5-2559527.pdf?src-supplier=Digikey
R98 = CRCW06034K64FKEA: RES SMD 4.64K OHM 1% 1/10W 0603; Manufacturer: Vishay; Item Type: Resistors; Value: 4.64kR; Power Rating: 100mW; Temperature Coefficient: 100ppm/°C; Voltage Rating: 75V; Supplier: Mouser; LCSC Part Number: C844174; Manufacturer Part Number: CRCW06034K64FKEA; RoHS: Yes; Stock: 38921; Pricing: 1=0.1, 10=0.017, 50=0.017, 100=0.01, 1000=0.008, 10000=0.005 (USD); Case/Package: 0603; Contact Plating: Tin; Weight: 7.1E-05oz; Case Code (Metric): 1608; Case Code (Imperial): 0603; Min Operating Temperature: -55°C; Max Operating Temperature: 155°C; Tolerance: 1%; Packaging: Tape and Reel; Termination: SMD/SMT; Package Quantity: 10; Resistor Type: Thick Film; Number of Terminations: 2; Max Power Dissipation: 100mW; Features: Automotive AEC-Q200; Series: CRCW; Working Voltage: 75V; Resistance Tolerance: 1%; Technology: THICK FILM; Construction: Rectangular; Voltage Rating (DC): 75V; Length: 1.55mm; Width: 0.033inch; Height: 0.45mm; Depth: 0.85mm; Ratings: AEC-Q200; Radiation Hardening: No; RoHS Compliant: Yes; Lead Free: 5697LeadFree; Military Standard: Not; Reach SVHC Compliant: Unknown; ComponentLink1URL: https://datasheet.ciiva.com/11811/0900766b80d98afc-11811841.pdf?src-supplier=Rs; ComponentLink1Description: https://datasheet.ciiva.com/11811/0900766b80d98afc-11811841.pdf?src-supplier=Rs; ComponentLink2URL: https://datasheet.ciiva.com/16199/dcrcwe3-16199878.pdf?src-supplier=Future+Electronics; ComponentLink2Description: https://datasheet.ciiva.com/16199/dcrcwe3-16199878.pdf?src-supplier=Future+Electronics; ComponentLink3URL: https://datasheet.ciiva.com/22675/1912744-22675963.pdf?src-supplier=Element14; ComponentLink3Description: https://datasheet.ciiva.com/22675/1912744-22675963.pdf?src-supplier=Element14; ComponentLink4URL: https://datasheet.ciiva.com/2465/dcrcwe3-2465796.pdf?src-supplier=Digikey; ComponentLink4Description: https://datasheet.ciiva.com/2465/dcrcwe3-2465796.pdf?src-supplier=Digikey; ComponentLink5URL: https://datasheet.ciiva.com/3257/dcrcwe3-3257663.pdf?src-supplier=Avnet; ComponentLink5Description: https://datasheet.ciiva.com/3257/dcrcwe3-3257663.pdf?src-supplier=Avnet; ComponentLink6URL: https://datasheet.ciiva.com/2465/dcrcwe3-2465797.pdf?src-supplier=Digikey; ComponentLink6Description: https://datasheet.ciiva.com/2465/dcrcwe3-2465797.pdf?src-supplier=Digikey; ComponentLink7URL: https://datasheet.ciiva.com/2465/dcrcwe3-2465795.pdf?src-supplier=Digikey; ComponentLink7Description: https://datasheet.ciiva.com/2465/dcrcwe3-2465795.pdf?src-supplier=Digikey; ComponentLink8URL: https://datasheet.ciiva.com/16767/70201119-16767079.pdf?src-supplier=Allied+Electronics; ComponentLink8Description: https://datasheet.ciiva.com/16767/70201119-16767079.pdf?src-supplier=Allied+Electronics; ComponentLink9URL: https://datasheet.ciiva.com/22871/70201119-22871831.pdf?src-supplier=Allied+Electronics; ComponentLink9Description: https://datasheet.ciiva.com/22871/70201119-22871831.pdf?src-supplier=Allied+Electronics; ComponentLink10URL: https://datasheet.ciiva.com/5542/dcrcwe3-109170-5542042.pdf?src-supplier=Mouser; ComponentLink10Description: https://datasheet.ciiva.com/5542/dcrcwe3-109170-5542042.pdf?src-supplier=Mouser; Supplier Part Number: YAG4536CT-ND; Category: Chip SMD Resistors; ComponentLink11URL: https://datasheet.ciiva.com/2585/pyu-rt-1-to-0-05-rohs-l-5-2585895.pdf?src-supplier=Digikey; ComponentLink11Description: https://datasheet.ciiva.com/2585/pyu-rt-1-to-0-05-rohs-l-5-2585895.pdf?src-supplier=Digikey
R99 = RT0603BRD07348RL: RES SMD 348 OHM 0.1% 1/10W 0603; Manufacturer: Yageo; Item Type: Resistors; Power Rating: 100mW; Voltage Rating: 75V; Temperature Coefficient: 25ppm/°C; Voltage Rating (DC): 50V; Supplier: Digikey; LCSC Part Number: C861337; Manufacturer Part Number: RT0603BRD07348RL; RoHS: Yes; Stock: 5186; Pricing: 1=0.14, 10=0.106, 50=0.0846, 100=0.0755, 500=0.05814, 1000=0.051 (USD); Case/Package: 0603; Case Code (Imperial): 0603; Case Code (Metric): 1608; Min Operating Temperature: -55°C; Max Operating Temperature: 155°C; Tolerance: 0.1%; Value: 348R; Package Quantity: 5000; Packaging: Tape and Reel; Termination: SMD/SMT; Number of Terminations: 2; Max Power Dissipation: 100mW; Series: RT; Length: 0.063inch; Width: 0.031inch; Height: 0.022inch; Lead Free: Lead Free; RoHS Compliant: Yes; ComponentLink1URL: https://datasheet.ciiva.com/2585/pyu-rt-1-to-0-05-rohs-l-5-2585895.pdf?src-supplier=Digikey; ComponentLink1Description: https://datasheet.ciiva.com/2585/pyu-rt-1-to-0-05-rohs-l-5-2585895.pdf?src-supplier=Digikey
R100 = CRCW0603562RFKEA: RES SMD 562 OHM 1% 1/10W 0603; Manufacturer: Vishay; Item Type: Resistors; Voltage Rating (DC): 75V; Supplier: Mouser; LCSC Part Number: C3013827; Manufacturer Part Number: CRCW0603562RFKEA; RoHS: Yes; Stock: 59904; Pricing: 1=0.1, 10=0.017, 50=0.017, 100=0.013, 1000=0.009, 10000=0.006 (USD); Lead Free: 5697LeadFree; ComponentLink1URL: https://datasheet.ciiva.com/11810/0900766b80d98afc-11810929.pdf?src-supplier=Rs; ComponentLink1Description: https://datasheet.ciiva.com/11810/0900766b80d98afc-11810929.pdf?src-supplier=Rs; ComponentLink2URL: https://datasheet.ciiva.com/7882/1533075-7882061.pdf?src-supplier=Element14; ComponentLink2Description: https://datasheet.ciiva.com/7882/1533075-7882061.pdf?src-supplier=Element14; ComponentLink3URL: https://datasheet.ciiva.com/16391/dcrcw-16391085.pdf?src-supplier=Future+Electronics; ComponentLink3Description: https://datasheet.ciiva.com/16391/dcrcw-16391085.pdf?src-supplier=Future+Electronics; ComponentLink4URL: https://datasheet.ciiva.com/16778/70201119-16778669.pdf?src-supplier=Allied+Electronics; ComponentLink4Description: https://datasheet.ciiva.com/16778/70201119-16778669.pdf?src-supplier=Allied+Electronics